# EAGLE design v6845-a (EAGLE 4.13)
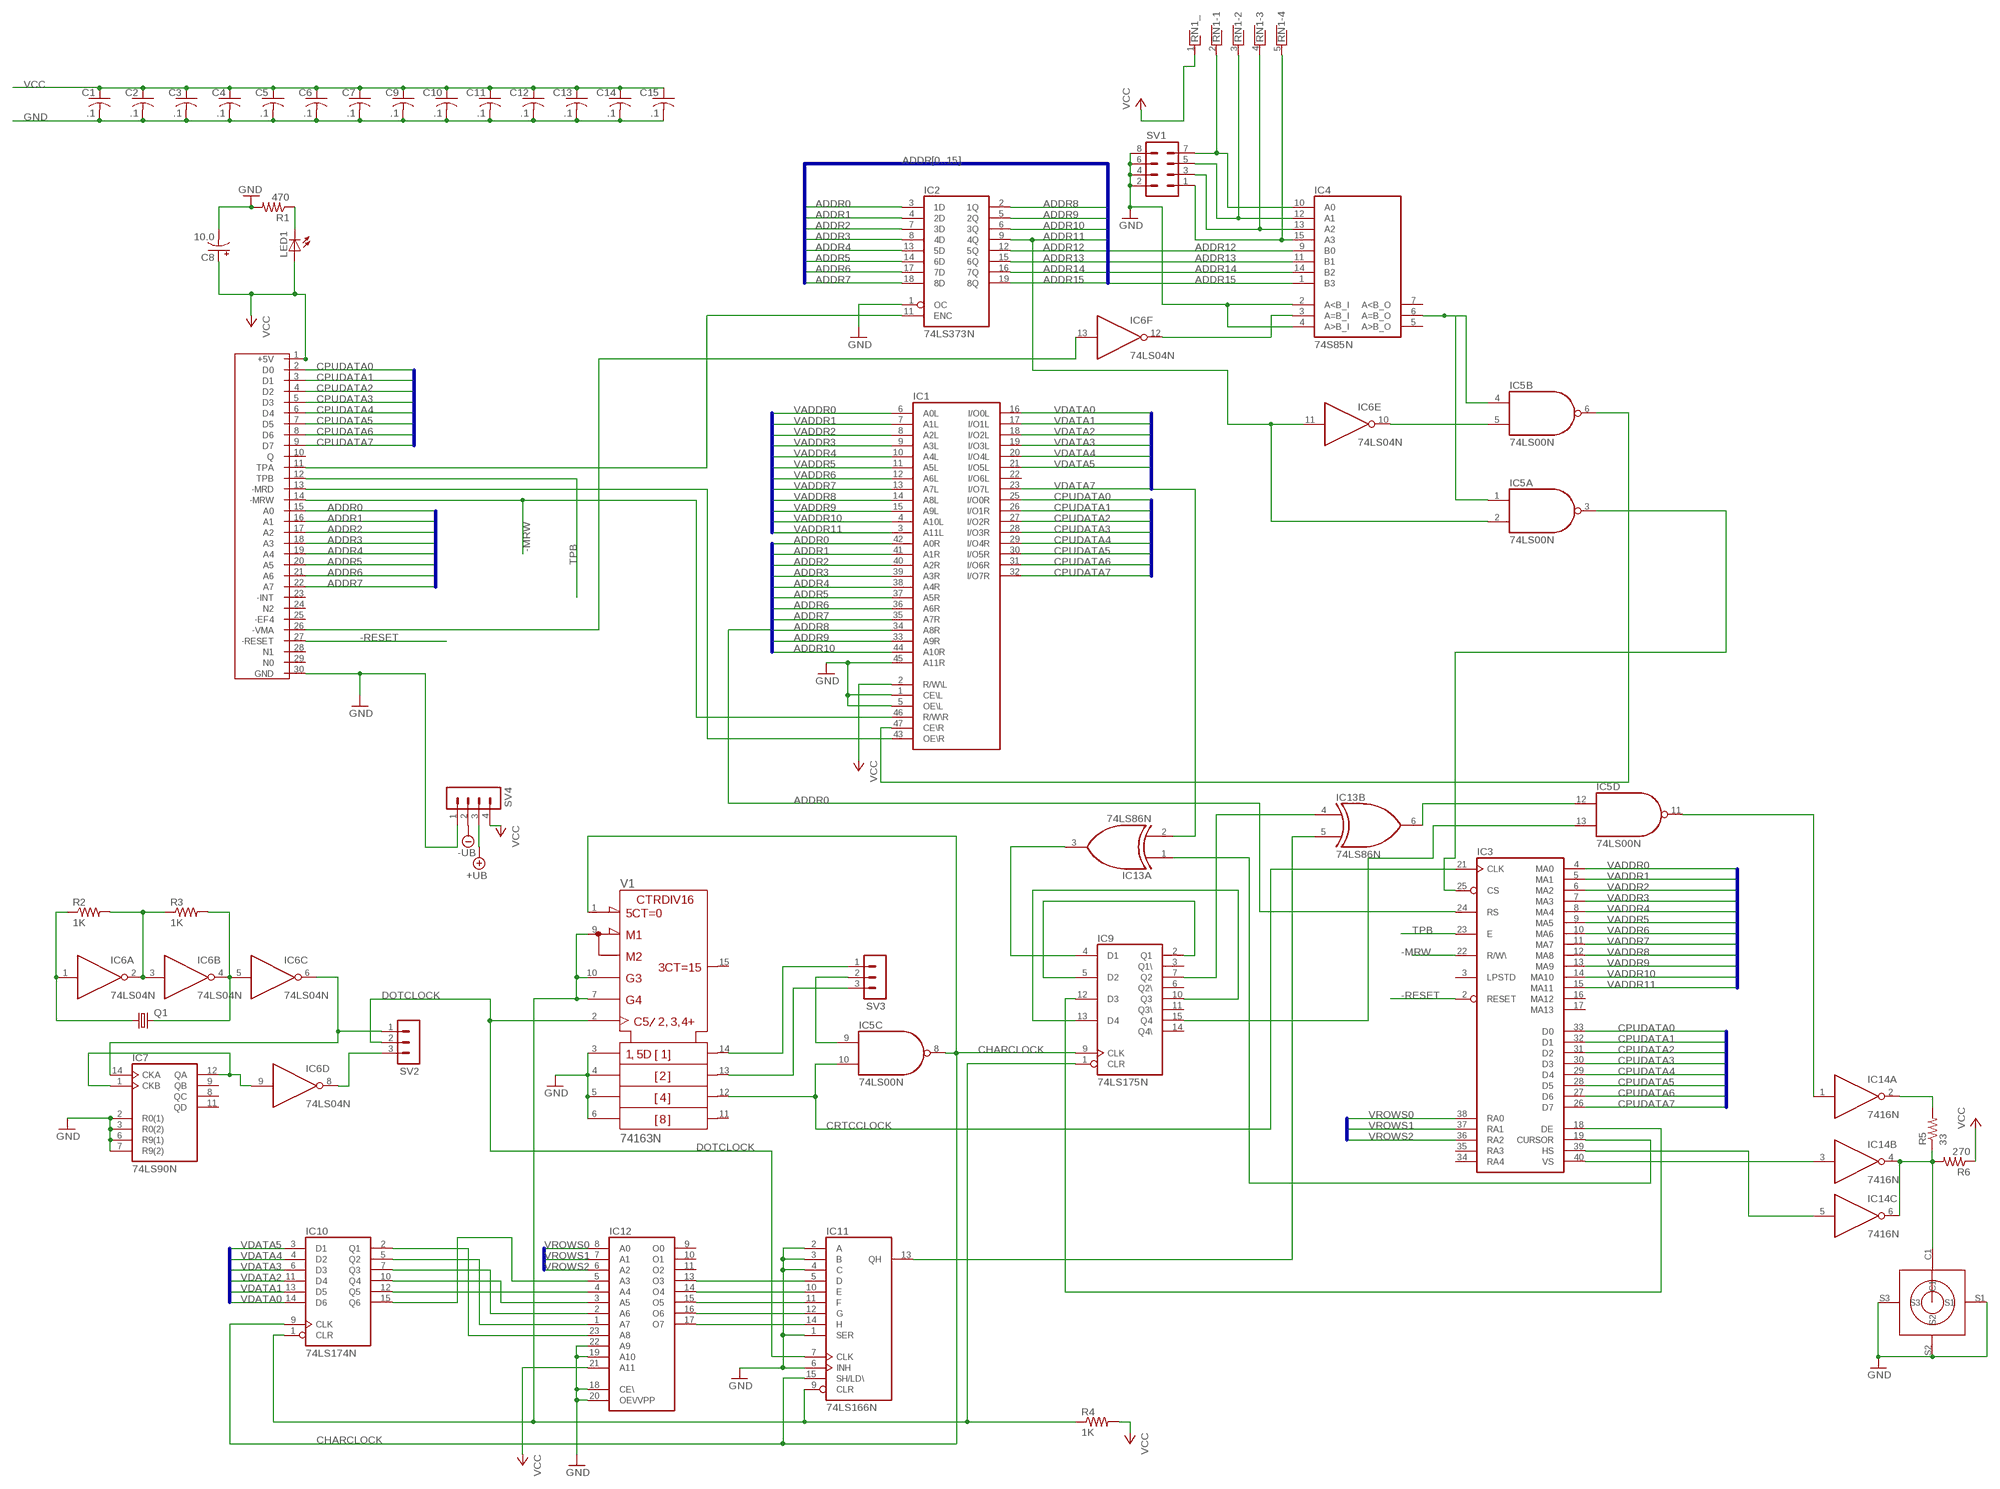
[diagram p0: schematic, sheet 1]

## Parts
C1  .1  C-US025-050X050  [C025-050X050]
C2  .1  C-US025-050X050  [C025-050X050]
C3  .1  C-US025-050X050  [C025-050X050]
C4  .1  C-US025-050X050  [C025-050X050]
C5  .1  C-US025-050X050  [C025-050X050]
C6  .1  C-US025-050X050  [C025-050X050]
C7  .1  C-US025-050X050  [C025-050X050]
C8  10.0  CPOL-USE2.5-7  [E2,5-7]
C9  .1  C-US025-050X050  [C025-050X050]
C10  .1  C-US025-050X050  [C025-050X050]
C11  .1  C-US025-050X050  [C025-050X050]
C12  .1  C-US025-050X050  [C025-050X050]
C13  .1  C-US025-050X050  [C025-050X050]
C14  .1  C-US025-050X050  [C025-050X050]
C15  .1  C-US025-050X050  [C025-050X050]
IC1  7134P  [DIL48]
IC2  74LS373N  [DIL20]
IC3  6845  [DIL40]
IC4  74S85N  [DIL16]
IC5  74LS00N  [DIL14]
IC6  74LS04N  [DIL14]
IC7  74LS90N  [DIL14]
IC9  74LS175N  [DIL16]
IC10  74LS174N  [DIL16]
IC11  74LS166N  [DIL16]
IC12  2732  [DIL24]
IC13  74LS86N  [DIL14]
IC14  7416N  [DIL14]
LED1  LED5MM  [LED5MM]
Q1  CRYTALHC49U-V  [HC49U-V]
R1  470  R-US_0207/7  [0207/7]
R2  1K  R-US_0207/7  [0207/7]
R3  1K  R-US_0207/7  [0207/7]
R4  1K  R-US_0207/7  [0207/7]
R5  33  R-US_0207/7  [0207/7]
R6  270  R-US_0207/7  [0207/7]
RN1  RNX4  [RN-5]
SV1  MA04-2  [MA04-2]
SV2  MA03-1  [MA03-1]
SV3  MA03-1  [MA03-1]
SV4  MA04-1  [MA04-1]
U$1  C30  [C30]
U$4  RCA  [RCA]
V1  74163N  [DIL16]

## Nets
+UB: SV4.3
-MRW: IC1.46(R/W\R) IC3.22(R/W\) U$1.14(-MRW)
-RESET: IC3.2(RESET) U$1.27(-RESET)
-UB: SV4.2
ADDR0: IC1.42(A0R) IC2.3(1D) IC3.24(RS) U$1.15(A0)
ADDR1: IC1.41(A1R) IC2.4(2D) U$1.16(A1)
ADDR2: IC1.40(A2R) IC2.7(3D) U$1.17(A2)
ADDR3: IC1.39(A3R) IC2.8(4D) U$1.18(A3)
ADDR4: IC1.38(A4R) IC2.13(5D) U$1.19(A4)
ADDR5: IC1.37(A5R) IC2.14(6D) U$1.20(A5)
ADDR6: IC1.36(A6R) IC2.17(7D) U$1.21(A6)
ADDR7: IC1.35(A7R) IC2.18(8D) U$1.22(A7)
ADDR8: IC1.34(A8R) IC2.2(1Q)
ADDR9: IC1.33(A9R) IC2.5(2Q)
ADDR10: IC1.44(A10R) IC2.6(3Q)
ADDR11: IC2.9(4Q) IC5.2(A:I1) IC6.11(E:I)
ADDR12: IC2.12(5Q) IC4.9(B0)
ADDR13: IC2.15(6Q) IC4.11(B1)
ADDR14: IC2.16(7Q) IC4.14(B2)
ADDR15: IC2.19(8Q) IC4.1(B3)
CHARCLOCK: IC5.8(C:O) IC9.9(CLK) IC10.9(CLK) IC11.15(SH/LD\) V1.1(CLR\)
CPUDATA0: IC1.25(I/O0R) IC3.33(D0) U$1.2(D0)
CPUDATA1: IC1.26(I/O1R) IC3.32(D1) U$1.3(D1)
CPUDATA2: IC1.27(I/O2R) IC3.31(D2) U$1.4(D2)
CPUDATA3: IC1.28(I/O3R) IC3.30(D3) U$1.5(D3)
CPUDATA4: IC1.29(I/O4R) IC3.29(D4) U$1.6(D4)
CPUDATA5: IC1.30(I/O5R) IC3.28(D5) U$1.7(D5)
CPUDATA6: IC1.31(I/O6R) IC3.27(D6) U$1.8(D6)
CPUDATA7: IC1.32(I/O7R) IC3.26(D7) U$1.9(D7)
CRTCCLOCK: IC3.21(CLK) IC5.10(C:I1) V1.12(QC)
DOTCLOCK: IC11.7(CLK) SV2.2 V1.2(CLK)
GND: C1.2 C2.2 C3.2 C4.2 C5.2 C6.2 C7.2 C8.- C9.2 C10.2 C11.2 C12.2 C13.2 C14.2 C15.2 IC1.1(CE\L) IC1.5(OE\L) IC1.45(A11R) IC2.1(OC) IC4.2(A<B_I) IC4.4(A>B_I) IC7.2(R0(1)) IC7.3(R0(2)) IC7.6(R9(1)) IC7.7(R9(2)) IC11.1(SER) IC11.2(A) IC11.3(B) IC11.4(C) IC11.6(INH) IC12.18(CE\) IC12.19(A10) IC12.20(OE\/VPP) IC12.22(A9) R1.2 SV1.2 SV1.4 SV1.6 SV1.8 SV4.1 U$1.30(GND) U$4.S1 U$4.S2 U$4.S3 V1.3(A) V1.4(B) V1.5(C) V1.6(D)
N$1: IC1.43(OE\R) U$1.13(-MRD)
N$2: IC5.5(B:I1) IC6.10(E:O)
N$3: IC3.25(CS) IC5.3(A:O)
N$4: IC4.10(A0) RN1.2 SV1.7
N$5: IC4.12(A1) RN1.3 SV1.5
N$6: IC4.13(A2) RN1.4 SV1.3
N$7: IC4.15(A3) RN1.5 SV1.1
N$8: IC4.3(A=B_I) IC6.12(F:O)
N$9: IC1.47(CE\R) IC5.6(B:O)
N$10: IC9.1(CLR) IC10.1(CLR) IC11.9(CLR) R4.1 V1.7(ENP) V1.9(LOAD\) V1.10(ENT)
N$11: IC6.4(B:O) IC6.5(C:I) Q1.2 R3.2
N$12: IC6.1(A:I) Q1.1 R2.1
N$13: IC6.6(C:O) IC7.14(CKA) SV2.1
N$14: IC6.2(A:O) IC6.3(B:I) R2.2 R3.1
N$15: IC6.9(D:I) IC7.1(CKB) IC7.12(QA)
N$16: IC6.8(D:O) SV2.3
N$17: IC3.19(CURSOR) IC13.1(A:I0)
N$18: SV3.1 V1.14(QA)
N$19: SV3.3 V1.13(QB)
N$20: IC5.9(C:I0) SV3.2
N$21: IC9.4(D1) IC13.3(A:O)
N$22: LED1.K(C) R1.1
N$23: IC9.2(Q1) IC9.5(D2)
N$24: IC11.5(D) IC12.13(O3)
N$25: IC11.10(E) IC12.14(O4)
N$26: IC11.11(F) IC12.15(O5)
N$27: IC11.12(G) IC12.16(O6)
N$28: IC11.14(H) IC12.17(O7)
N$29: IC10.2(Q1) IC12.23(A8)
N$30: IC10.5(Q2) IC12.1(A7)
N$31: IC10.7(Q3) IC12.2(A6)
N$32: IC10.10(Q4) IC12.3(A5)
N$33: IC10.12(Q5) IC12.4(A4)
N$34: IC10.15(Q6) IC12.5(A3)
N$35: IC9.7(Q2) IC13.4(B:I0)
N$36: IC11.13(QH) IC13.5(B:I1)
N$37: IC9.10(Q3) IC9.13(D4)
N$38: IC3.18(DE) IC9.12(D3)
N$39: IC5.12(D:I0) IC13.6(B:O)
N$40: IC5.13(D:I1) IC9.15(Q4)
N$41: IC3.40(VS) IC14.3(B:I)
N$42: IC3.39(HS) IC14.5(C:I)
N$43: IC5.11(D:O) IC14.1(A:I)
N$44: IC14.4(B:O) IC14.6(C:O) R5.1 R6.2 U$4.C1
N$45: IC14.2(A:O) R5.2
N$46: IC4.6(A=B_O) IC5.1(A:I0) IC5.4(B:I0)
N$47: IC6.13(F:I) U$1.26(-VMA)
TPA: IC2.11(ENC) U$1.11(TPA)
TPB: IC3.23(E) U$1.12(TPB)
VADDR0: IC1.6(A0L) IC3.4(MA0)
VADDR1: IC1.7(A1L) IC3.5(MA1)
VADDR2: IC1.8(A2L) IC3.6(MA2)
VADDR3: IC1.9(A3L) IC3.7(MA3)
VADDR4: IC1.10(A4L) IC3.8(MA4)
VADDR5: IC1.11(A5L) IC3.9(MA5)
VADDR6: IC1.12(A6L) IC3.10(MA6)
VADDR7: IC1.13(A7L) IC3.11(MA7)
VADDR8: IC1.14(A8L) IC3.12(MA8)
VADDR9: IC1.15(A9L) IC3.13(MA9)
VADDR10: IC1.4(A10L) IC3.14(MA10)
VADDR11: IC1.3(A11L) IC3.15(MA11)
VCC: C1.1 C2.1 C3.1 C4.1 C5.1 C6.1 C7.1 C8.+ C9.1 C10.1 C11.1 C12.1 C13.1 C14.1 C15.1 IC1.2(R/W\L) IC12.21(A11) LED1.A R4.2 R6.1 RN1.1 SV4.4 U$1.1(+5V)
VDATA0: IC1.16(I/O0L) IC10.14(D6)
VDATA1: IC1.17(I/O1L) IC10.13(D5)
VDATA2: IC1.18(I/O2L) IC10.11(D4)
VDATA3: IC1.19(I/O3L) IC10.6(D3)
VDATA4: IC1.20(I/O4L) IC10.4(D2)
VDATA5: IC1.21(I/O5L) IC10.3(D1)
VDATA7: IC1.23(I/O7L) IC13.2(A:I1)
VROWS0: IC3.38(RA0) IC12.8(A0)
VROWS1: IC3.37(RA1) IC12.7(A1)
VROWS2: IC3.36(RA2) IC12.6(A2)
Unconnected: IC1.22(I/O6L) IC3.3(LPSTD) IC3.16(MA12) IC3.17(MA13) IC3.34(RA4) IC3.35(RA3) IC4.5(A>B_O) IC4.7(A<B_O) IC7.8(QC) IC7.9(QB) IC7.11(QD) IC9.3(Q1\) IC9.6(Q2\) IC9.11(Q3\) IC9.14(Q4\) IC12.9(O0) IC12.10(O1) IC12.11(O2) IC13.8(C:O) IC13.9(C:I0) IC13.10(C:I1) IC13.11(D:O) IC13.12(D:I0) IC13.13(D:I1) IC14.8(D:O) IC14.9(D:I) IC14.10(E:O) IC14.11(E:I) IC14.12(F:O) IC14.13(F:I) U$1.10(Q) U$1.23(-INT) U$1.24(N2) U$1.25(-EF4) U$1.28(N1) U$1.29(N0) V1.11(QD) V1.15(RCO)

## Buses
VADDR[0..11]
VDATA[0..7]
CPUDATA[0..7]
ADDR[0..15]
VROWS[0..4]

## Power pins joined to a net without a drawn wire
+UB: V1.16(+UB)
-UB: V1.8(-UB)
GND: IC1.24(GND) IC2.10(GND) IC3.1(GND) IC4.8(GND) IC5.7(P:GND) IC6.7(P:GND) IC7.10(GND) IC9.8(GND) IC10.8(GND) IC11.8(GND) IC12.12(GND) IC13.7(P:GND) IC14.7(P:GND)
VCC: IC1.48(VCC) IC2.20(VCC) IC3.20(VCC) IC4.16(VCC) IC5.14(P:VCC) IC6.14(P:VCC) IC7.5(VCC) IC9.16(VCC) IC10.16(VCC) IC11.16(VCC) IC12.24(VCC) IC13.14(P:VCC) IC14.14(P:VCC)

## Library data of the parts
C1-C7 C9-C15 = rcl:C-US: CAPACITOR, American symbol
C8 = rcl:CPOL-US: POLARIZED CAPACITOR, American symbol
IC1 = memory-idt:7134P: MEMORY
IC2 = 74xx-us:74*373: Octal D type transparent LATCH, edge triggered
IC3 = micro-motorola:6845: MICROCONTROLLER/MEMORY DEVICE
IC4 = 74xx-us:74*85: 4-bit magnitude COMPARATOR
IC5 = 74xx-us:74*00: Quad 2-input NAND gate
IC6 = 74xx-us:74*04: Hex INVERTER
IC7 = 74xx-us:74*90: Decade, divide by twelve and binary COUNTER
IC9 = 74xx-us:74*175: Qadruple D type FLIP FLOP, clear
IC10 = 74xx-us:74*174: Hex D type FLIP FLOP, clear
IC11 = 74xx-us:74*166: 8-bit parallel load SHIFT REGISTER
IC12 = memory:2732: MEMORY
IC13 = 74xx-us:74*86: Quad 2-input EXCLUSIV-OR (XOR) gate
IC14 = 74xx-us:74*16: Hex INVERTER, open collector, high-voltage
LED1 = led:LED: LED OSRAM: - CHIPLED LG R971, LG N971, LY N971, LG Q971, LY Q971, LO R971, LY R971 LH N974, LH R974 LS Q976, LO Q976, LY Q976 LO Q996 - Hyper CHIPLED LW Q18S LB Q993, LB Q99A, LB R99A - SideLED LS A670, LO A670, LY A670, LG A670, LP A670 LB A673, LV A673, LT A673, LW A673 LH A674 LY A675 LS A676, LA A676, LO A676, LY A676, LW A676 LS A679, LY A679, LG A679 - Hyper Micro SIDELED® LS Y876, LA Y876, LO Y876, LY Y876 LT Y87S - SmartLED LW L88C, LW L88S LB L89C, LB L89S, LG L890 LS L89K, LO L89K, LY L89K LS L896, LA L896, LO L896, LY L896 - TOPLED LS T670, LO T670, LY T670, LG T670, LP T670 LSG T670, LSP T670, LSY T670, LOP T670, LYG T670 LG T671, LOG T671, LSG T671 LB T673, LV T673, LT T673, LW T673 LH T674 LS T676, LA T676, LO T676, LY T676, LB T676, LH T676, LSB T676, LW T676 LB T67C, LV T67C, LT T67C, LS T67K, LO T67K, LY T67K, LW E67C LS E67B, LA E67B, LO E67B, LY E67B, LB E67C, LV E67C, LT E67C LW T67C LS T679, LY T679, LG T679 LS T770, LO T770, LY T770, LG T770, LP T770 LB T773, LV T773, LT T773, LW T773 LH T774 LS E675, LA E675, LY E675, LS T675 LS T776, LA T776, LO T776, LY T776, LB T776 LHGB T686 LT T68C, LB T68C - Hyper Mini TOPLED® LB M676 - Mini TOPLED Santana® LG M470 LS M47K, LO M47K, LY M47K Source: http://www.osram.convergy.de/
Q1 = crystal:CRYTAL: CRYSTAL
R1-R6 = rcl:R-US_: RESISTOR, American symbol
RN1 = resistor-net:RNX4: RESISTOR NETWORK
SV1 = con-lstb:MA04-2: PIN HEADER
SV2 SV3 = con-lstb:MA03-1: PIN HEADER
SV4 = con-lstb:MA04-1: PIN HEADER
U$1 = k1:C30
U$4 = cdp:RCA
V1 = 74ttl-din:74*163: Synchrounus 4-bit COUNTER

## Board
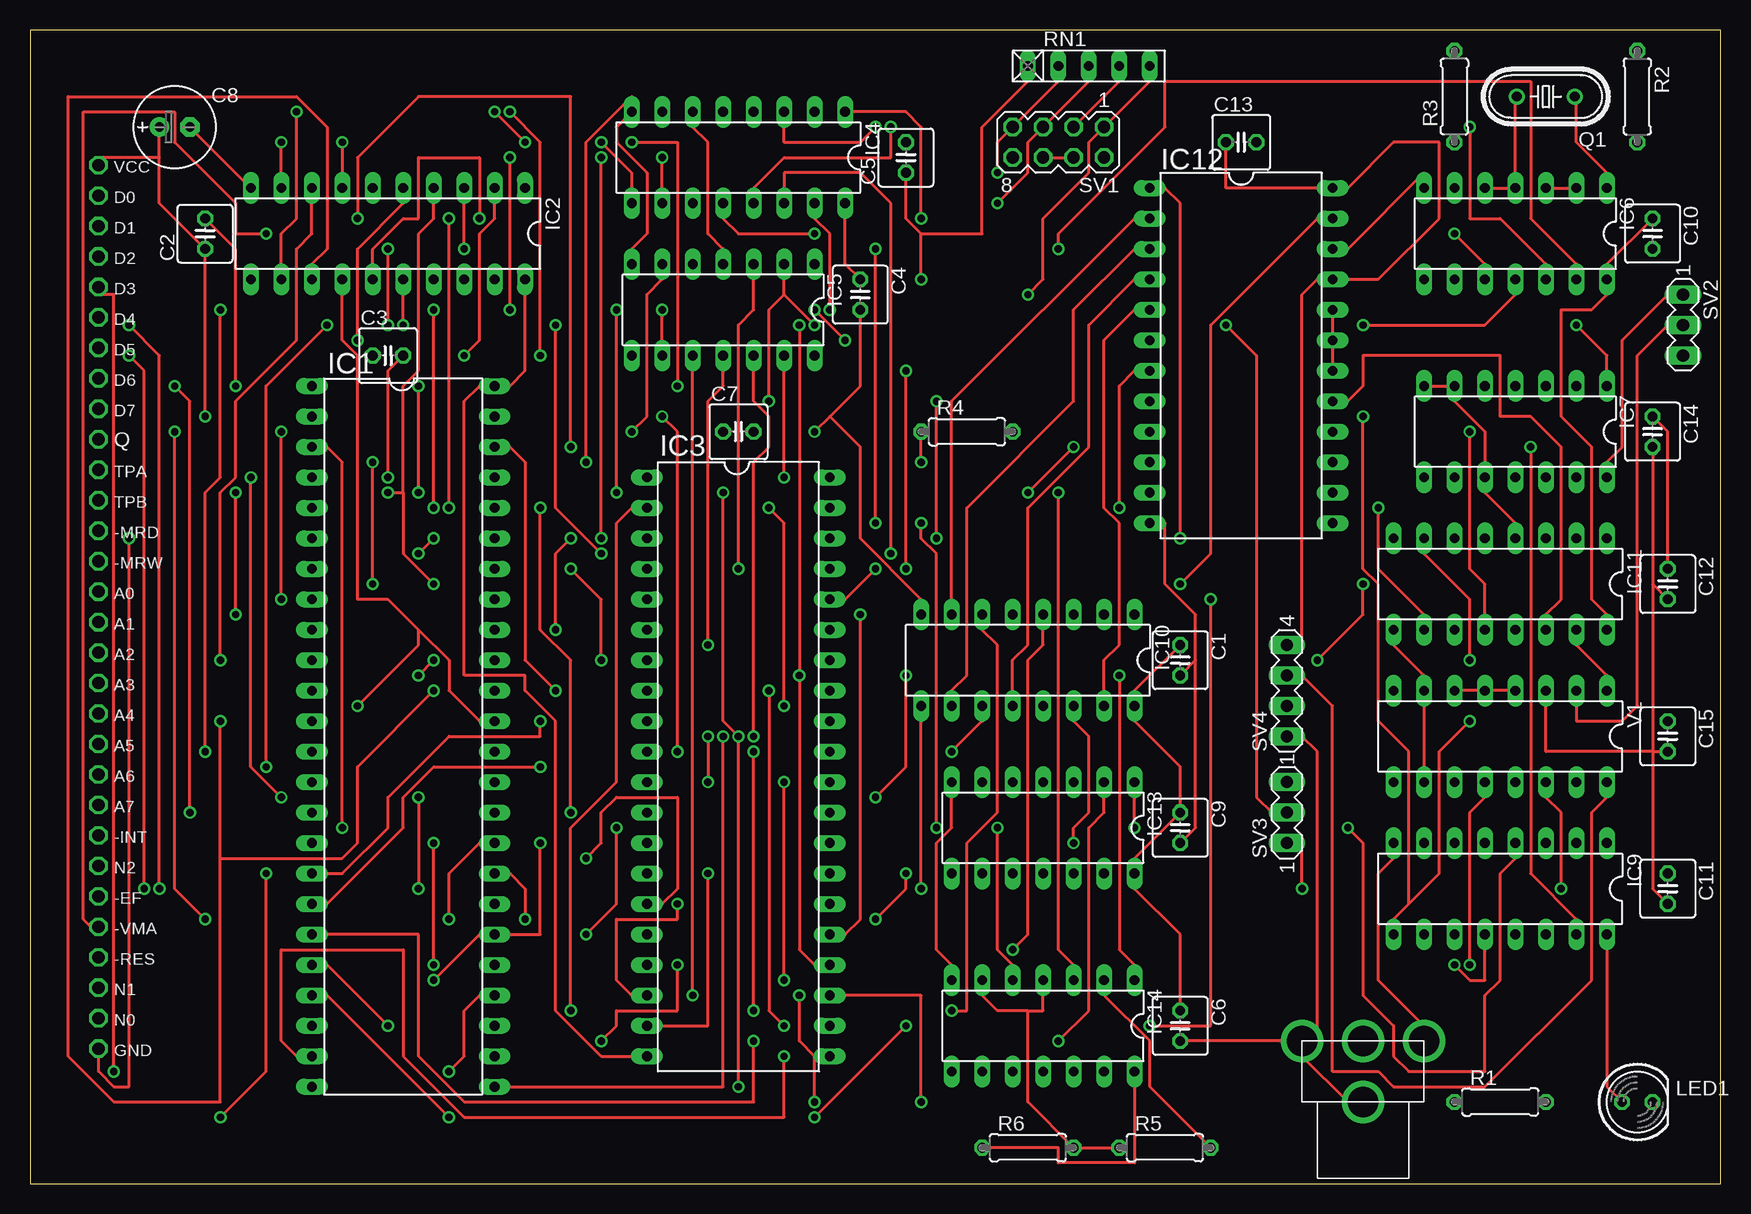
[diagram p1: board, top side]
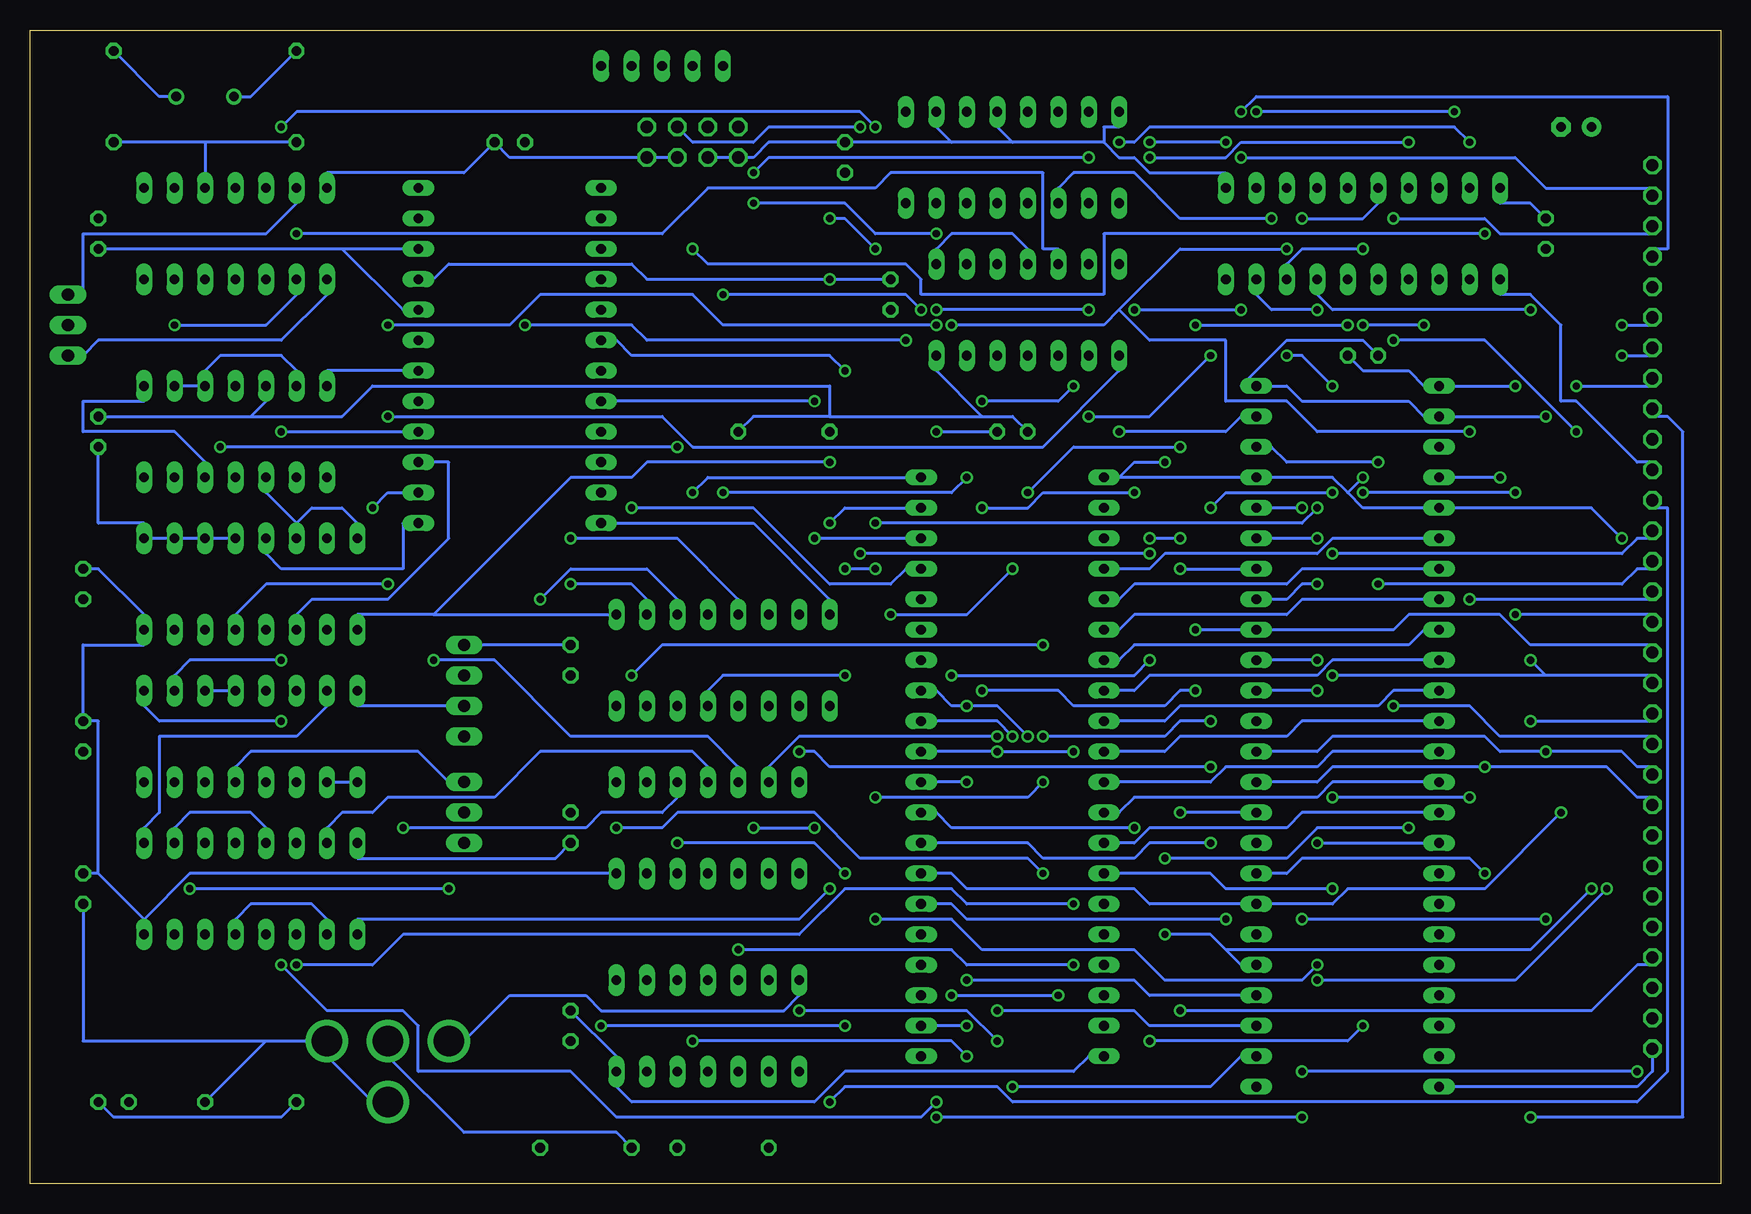
[diagram p2: board, bottom side, seen from below]

Size 140.95 x 96.19 mm. Coordinates in mm from the lower left corner, seen from the top.
Outline: 0,0 140.95,0 140.95,96.19 0,96.19 0,0
Copper layers (1*16): Top 0.035mm / dielectric 1.5mm / Bottom 0.035mm
Design rules "default": minimum track width 10mil, minimum drill 24mil, track to track 8mil, track to pad 8mil, pad to pad 8mil, via to via 8mil, smd to smd 8mil, copper to edge 40mil, drill to drill 8mil, minimum pad ring 10mil, minimum via ring 8mil, stop-mask expansion 4mil, vias tented up to drill 0mil, thermal gap 10mil
tRestrict: area 0.6,91.9 to 76.8,95.7; area 0.6,0.5 to 76.8,4.3
bRestrict: area 0.6,91.9 to 76.8,95.7; area 0.6,0.5 to 76.8,4.3

### Footprints (pad centres in the part's own frame; a part is rotated, then mirrored left to right if it is on the bottom)
C025-050X050 = drill 0.813 octagon: 1 -1.27,0; 2 1.27,0
E2,5-7 = drill 0.813 pad 1.6 round: + -1.27,0 | drill 0.813 pad 1.6 octagon: - 1.27,0
DIL48 = drill 0.813 long: 1 -29.21,-7.62; 2 -26.67,-7.62; 3 -24.13,-7.62; 4 -21.59,-7.62; 5 -19.05,-7.62; 6 -16.51,-7.62; 7 -13.97,-7.62; 8 -11.43,-7.62; 9 -8.89,-7.62; 10 -6.35,-7.62; 11 -3.81,-7.62; 12 -1.27,-7.62; 13 1.27,-7.62; 14 3.81,-7.62; 15 6.35,-7.62; 16 8.89,-7.62; 17 11.43,-7.62; 18 13.97,-7.62; 19 16.51,-7.62; 20 19.05,-7.62; 21 21.59,-7.62; 22 24.13,-7.62; 23 26.67,-7.62; 24 29.21,-7.62; 25 29.21,7.62; 26 26.67,7.62; 27 24.13,7.62; 28 21.59,7.62; 29 19.05,7.62; 30 16.51,7.62; 31 13.97,7.62; 32 11.43,7.62; 33 8.89,7.62; 34 6.35,7.62; 35 3.81,7.62; 36 1.27,7.62; 37 -1.27,7.62; 38 -3.81,7.62; 39 -6.35,7.62; 40 -8.89,7.62; 41 -11.43,7.62; 42 -13.97,7.62; 43 -16.51,7.62; 44 -19.05,7.62; 45 -21.59,7.62; 46 -24.13,7.62; 47 -26.67,7.62; 48 -29.21,7.62
DIL20 = drill 0.813 long: 1 -11.43,-3.81; 2 -8.89,-3.81; 3 -6.35,-3.81; 4 -3.81,-3.81; 5 -1.27,-3.81; 6 1.27,-3.81; 7 3.81,-3.81; 8 6.35,-3.81; 9 8.89,-3.81; 10 11.43,-3.81; 11 11.43,3.81; 12 8.89,3.81; 13 6.35,3.81; 14 3.81,3.81; 15 1.27,3.81; 16 -1.27,3.81; 17 -3.81,3.81; 18 -6.35,3.81; 19 -8.89,3.81; 20 -11.43,3.81
DIL40 = drill 0.813 long: 1 -24.13,-7.62; 2 -21.59,-7.62; 3 -19.05,-7.62; 4 -16.51,-7.62; 5 -13.97,-7.62; 6 -11.43,-7.62; 7 -8.89,-7.62; 8 -6.35,-7.62; 9 -3.81,-7.62; 10 -1.27,-7.62; 11 1.27,-7.62; 12 3.81,-7.62; 13 6.35,-7.62; 14 8.89,-7.62; 15 11.43,-7.62; 16 13.97,-7.62; 17 16.51,-7.62; 18 19.05,-7.62; 19 21.59,-7.62; 20 24.13,-7.62; 21 24.13,7.62; 22 21.59,7.62; 23 19.05,7.62; 24 16.51,7.62; 25 13.97,7.62; 26 11.43,7.62; 27 8.89,7.62; 28 6.35,7.62; 29 3.81,7.62; 30 1.27,7.62; 31 -1.27,7.62; 32 -3.81,7.62; 33 -6.35,7.62; 34 -8.89,7.62; 35 -11.43,7.62; 36 -13.97,7.62; 37 -16.51,7.62; 38 -19.05,7.62; 39 -21.59,7.62; 40 -24.13,7.62
DIL16 = drill 0.813 long: 1 -8.89,-3.81; 2 -6.35,-3.81; 3 -3.81,-3.81; 4 -1.27,-3.81; 5 1.27,-3.81; 6 3.81,-3.81; 7 6.35,-3.81; 8 8.89,-3.81; 9 8.89,3.81; 10 6.35,3.81; 11 3.81,3.81; 12 1.27,3.81; 13 -1.27,3.81; 14 -3.81,3.81; 15 -6.35,3.81; 16 -8.89,3.81
DIL14 = drill 0.813 long: 1 -7.62,-3.81; 2 -5.08,-3.81; 3 -2.54,-3.81; 4 0,-3.81; 5 2.54,-3.81; 6 5.08,-3.81; 7 7.62,-3.81; 8 7.62,3.81; 9 5.08,3.81; 10 2.54,3.81; 11 0,3.81; 12 -2.54,3.81; 13 -5.08,3.81; 14 -7.62,3.81
DIL24 = drill 0.813 long: 1 -13.97,-7.62; 2 -11.43,-7.62; 3 -8.89,-7.62; 4 -6.35,-7.62; 5 -3.81,-7.62; 6 -1.27,-7.62; 7 1.27,-7.62; 8 3.81,-7.62; 9 6.35,-7.62; 10 8.89,-7.62; 11 11.43,-7.62; 12 13.97,-7.62; 13 13.97,7.62; 14 11.43,7.62; 15 8.89,7.62; 16 6.35,7.62; 17 3.81,7.62; 18 1.27,7.62; 19 -1.27,7.62; 20 -3.81,7.62; 21 -6.35,7.62; 22 -8.89,7.62; 23 -11.43,7.62; 24 -13.97,7.62
LED5MM = drill 0.813 octagon: A -1.27,0; K 1.27,0
HC49U-V = drill 0.813 round: 1 -2.413,0; 2 2.413,0
0207/7 = drill 0.813 octagon: 1 -3.81,0; 2 3.81,0
RN-5 = drill 0.813 long: 1 -5.08,0; 2 -2.54,0; 3 0,0; 4 2.54,0; 5 5.08,0
MA04-2 = drill 1.016 octagon: 1 -3.81,-1.27; 2 -3.81,1.27; 3 -1.27,-1.27; 4 -1.27,1.27; 5 1.27,-1.27; 6 1.27,1.27; 7 3.81,-1.27; 8 3.81,1.27
MA03-1 = drill 1.016 long: 1 -2.54,0; 2 0,0; 3 2.54,0
MA04-1 = drill 1.016 long: 1 -3.81,0; 2 -1.27,0; 3 1.27,0; 4 3.81,0
C30 = drill 1.016 octagon: 1 -36.83,0; 2 -34.29,0; 3 -31.75,0; 4 -29.21,0; 5 -26.67,0; 6 -24.13,0; 7 -21.59,0; 8 -19.05,0; 9 -16.51,0; 10 -13.97,0; 11 -11.43,0; 12 -8.89,0; 13 -6.35,0; 14 -3.81,0; 15 -1.27,0; 16 1.27,0; 17 3.81,0; 18 6.35,0; 19 8.89,0; 20 11.43,0; 21 13.97,0; 22 16.51,0; 23 19.05,0; 24 21.59,0; 25 24.13,0; 26 26.67,0; 27 29.21,0; 28 31.75,0; 29 34.29,0; 30 36.83,0
RCA = drill 2.54 round: C1 5.08,0; S1 0,0; S2 5.08,5.08; S3 10.16,0

### Placement (x,y rotation side)
C1  95.88,43.65 270 top
C2  14.6,79.21 90 top
C3  29.84,69.05 0 top
C4  69.21,74.13 270 top
C5  73.02,85.56 90 top
C6  95.88,13.17 270 top
C7  59.05,62.7 0 top
C8  12.06,88.1 0 top
C9  95.88,29.68 270 top
C10  135.25,79.21 270 top
C11  136.52,24.6 270 top
C12  136.52,50 270 top
C13  100.96,86.83 0 top
C14  135.25,62.7 270 top
C15  136.52,37.3 270 top
IC1  31.11,37.3 270 top
IC2  29.84,79.21 180 top
IC3  59.05,34.76 270 top
IC4  59.05,85.56 180 top
IC5  57.78,72.86 180 top
IC6  123.82,79.21 180 top
IC7  123.82,62.7 180 top
IC9  122.55,24.6 180 top
IC10  83.18,43.65 180 top
IC11  122.55,50 180 top
IC12  100.96,69.05 270 top
IC13  84.45,29.68 180 top
IC14  84.45,13.17 180 top
LED1  133.98,6.82 0 top
Q1  126.36,90.64 180 top
R1  122.55,6.82 0 top
R2  133.98,90.64 270 top
R3  118.74,90.64 90 top
R4  78.1,62.7 0 top
R5  94.61,3.01 0 top
R6  83.18,3.01 0 top
RN1  88.26,93.18 0 top
SV1  85.72,86.83 180 top
SV2  137.79,71.59 270 top
SV3  104.77,30.95 90 top
SV4  104.77,41.11 90 top
U$1  5.71,48.09 270 top
U$4  116.2,11.9 180 top
V1  122.55,37.3 180 top

### Tracks (layer width: path | path; a pad name or v marks a point on that pad's centre or on a via)
+UB
  Top 0.254: V1.16 131.44,32.22 130.17,30.95 130.17,16.98 121.28,8.09 113.66,8.09 112.39,9.36 108.58,9.36 108.58,39.84 106.04,42.38 SV4.3
-MRW  (via drill 0.61)
  Top 0.254: v28.57,50 v28.57,60.16 | v62.86,13.17 61.59,14.44 v61.59,41.11 | v43.81,41.11 41.27,43.65 41.27,60.16 40,61.43 IC1.46
  Bottom 0.254: v28.57,60.16 36.19,60.16 37.46,61.43 IC1.46 | v28.57,50 8.25,50 6.98,51.27 5.71,51.27 U$1.14 | v61.59,41.11 55.24,41.11 53.97,39.84 46.35,39.84 45.08,41.11 v43.81,41.11 | v62.86,13.17 IC3.22
-RESET  (via drill 0.61)
  Top 0.254: v45.08,14.44 45.08,29.68 48.89,33.49 48.89,55.08 50.16,56.35 IC3.2
  Bottom 0.254: v45.08,14.44 10.79,14.44 6.98,18.25 5.71,18.25 U$1.27
-UB
  Bottom 0.254: V1.8 113.66,39.84 SV4.2
ADDR0  (via drill 0.61)
  Top 0.254: v64.13,71.59 v64.13,42.38 64.13,19.52 65.4,18.25 IC3.24 | v36.19,77.94 IC2.3 | v45.08,51.27 47.62,48.73 v47.62,43.65 | v20.95,48.73 v20.95,62.7
  Bottom 0.254: v36.19,77.94 45.08,77.94 50.16,72.86 | 50.16,72.86 51.43,71.59 v64.13,71.59 | v47.62,43.65 48.89,42.38 v64.13,42.38 | v45.08,51.27 IC1.42 | v20.95,48.73 5.71,48.73 U$1.15 | v20.95,62.7 33.65,62.7 36.19,65.24 41.27,65.24 41.27,70.32 47.62,70.32 50.16,72.86
ADDR1  (via drill 0.61)
  Top 0.254: v33.65,50 31.11,52.54 31.11,57.62 | 31.11,57.62 31.11,66.51 32.38,67.78 32.38,79.21 33.65,80.48 IC2.4 | v17.14,47.46 v17.14,57.62 | v29.84,57.62 31.11,57.62
  Bottom 0.254: v33.65,50 34.92,50 36.19,48.73 IC1.41 | v17.14,47.46 5.71,47.46 U$1.16 | v17.14,57.62 v29.84,57.62
ADDR2  (via drill 0.61)
  Top 0.254: v47.62,53.81 v47.62,85.56 | v45.08,53.81 43.81,52.54 v43.81,46.19 | v26.03,86.83 IC2.7
  Bottom 0.254: U$1.17 5.71,44.92 15.87,44.92 18.41,47.46 26.03,47.46 27.3,46.19 IC1.40 v43.81,46.19 | v26.03,86.83 40,86.83 41.27,85.56 v47.62,85.56 | v45.08,53.81 v47.62,53.81
ADDR3  (via drill 0.61)
  Top 0.254: v15.87,43.65 15.87,57.62 17.14,58.89 17.14,65.24 22.22,70.32 22.22,77.94 23.49,79.21 IC2.8 | v32.38,42.38 v33.65,43.65
  Bottom 0.254: 14.6,42.38 v15.87,43.65 | 14.6,42.38 5.71,42.38 U$1.18 | 14.6,42.38 v32.38,42.38 | v33.65,43.65 IC1.39
ADDR4  (via drill 0.61)
  Top 0.254: v33.65,41.11 27.3,34.76 27.3,28.41 26.03,27.14 15.87,27.14 | 15.87,27.14 v15.87,38.57 | 15.87,27.14 15.87,6.82 6.98,6.82 3.17,10.63 3.17,90.64 22.22,90.64 24.76,88.1 24.76,77.94 23.49,76.67 IC2.13
  Bottom 0.254: v15.87,38.57 5.71,38.57 U$1.19 | v33.65,41.11 IC1.38
ADDR5  (via drill 0.61)
  Top 0.254: 32.38,46.19 29.84,48.73 27.3,48.73 27.3,69.05 26.03,70.32 IC2.14 | 32.38,46.19 34.92,43.65 34.92,41.11 37.46,38.57 IC1.37 | v27.3,39.84 32.38,44.92 32.38,46.19
  Bottom 0.254: v27.3,39.84 20.95,39.84 18.41,37.3 5.71,37.3 U$1.20
ADDR6  (via drill 0.61)
  Top 0.254: v15.87,72.86 15.87,58.89 14.6,57.62 v14.6,36.03
  Bottom 0.254: v15.87,72.86 32.38,72.86 33.65,74.13 IC2.17 | U$1.21 5.71,34.76 6.98,34.76 8.25,36.03 v14.6,36.03 18.41,36.03 19.68,37.3 32.38,37.3 33.65,36.03 IC1.36
ADDR7  (via drill 0.61)
  Top 0.254: v29.84,71.59 v29.84,77.94 | v24.76,71.59 19.68,66.51 v19.68,34.76
  Bottom 0.254: IC1.35 33.65,33.49 32.38,34.76 v19.68,34.76 9.52,34.76 6.98,32.22 5.71,32.22 U$1.22 | v29.84,77.94 34.92,77.94 36.19,76.67 IC2.18 | v24.76,71.59 v29.84,71.59
ADDR8  (via drill 0.61)
  Top 0.254: v45.08,30.95 45.08,43.65 42.54,46.19 v42.54,56.35 | v32.38,57.62 v32.38,66.51 | v36.19,69.05 37.46,70.32 37.46,79.21 38.73,80.48 IC2.2
  Bottom 0.254: v42.54,56.35 41.27,57.62 v32.38,57.62 | v32.38,66.51 34.92,69.05 v36.19,69.05 | IC1.34 v45.08,30.95
ADDR9  (via drill 0.61)
  Top 0.254: v34.92,22.06 34.92,25.87 37.46,28.41 IC1.33 | v14.6,22.06 12.06,24.6 v12.06,62.7 | v27.3,70.32 27.3,77.94 31.11,81.75 IC2.5
  Bottom 0.254: v14.6,22.06 v34.92,22.06 | v12.06,62.7 19.68,70.32 v27.3,70.32
ADDR10  (via drill 0.61)
  Top 0.254: v34.92,56.35 v34.92,80.48
  Bottom 0.254: v34.92,80.48 29.84,80.48 28.57,81.75 IC2.6 | v34.92,56.35 IC1.44
ADDR11  (via drill 0.61)
  Top 0.254: v111.12,71.59 121.28,71.59 123.82,74.13 IC6.11 | 62.86,74.13 v65.4,71.59 | 62.86,74.13 IC5.2 | v50.16,86.83 53.97,86.83 v53.97,66.51 | v61.59,65.24 61.59,72.86 62.86,74.13 | IC2.9 v20.95,86.83
  Bottom 0.254: v111.12,71.59 100.96,71.59 98.42,74.13 85.72,74.13 83.18,71.59 v65.4,71.59 | v20.95,86.83 22.22,88.1 47.62,88.1 48.89,86.83 v50.16,86.83 | v53.97,66.51 55.24,65.24 v61.59,65.24
ADDR12  (via drill 0.61)
  Top 0.254: v22.22,89.37 22.22,80.48 20.95,79.21 IC2.12 | v38.73,89.37 v41.27,86.83 | v47.62,86.83 50.16,84.29 IC4.9
  Bottom 0.254: v22.22,89.37 v38.73,89.37 | v41.27,86.83 v47.62,86.83
ADDR13  (via drill 0.61)
  Top 0.254: v37.46,80.48 37.46,85.56 32.38,85.56 32.38,80.48 31.11,80.48 28.57,77.94 IC2.15
  Bottom 0.254: v37.46,80.48 45.08,80.48 48.89,84.29 53.97,84.29 55.24,83.02 IC4.11
ADDR14  (via drill 0.61)
  Top 0.254: v43.81,71.59 43.81,56.35 v47.62,52.54 | v71.75,52.54 71.75,81.75 69.21,84.29 62.86,84.29 IC4.14 | v31.11,71.59 IC2.16
  Bottom 0.254: v43.81,71.59 v31.11,71.59 | v47.62,52.54 v71.75,52.54
ADDR15  (via drill 0.61)
  Top 0.254: v33.65,56.35 v33.65,72.86 | v70.48,55.08 v70.48,77.94 | v74.29,80.48 74.29,88.1 73.02,89.37 IC4.1
  Bottom 0.254: v33.65,72.86 37.46,72.86 38.73,74.13 IC2.19 | v33.65,56.35 34.92,55.08 v70.48,55.08 | v70.48,77.94 73.02,80.48 v74.29,80.48
CHARCLOCK  (via drill 0.61)
  Top 0.254: V1.1 131.44,42.38 128.9,44.92 IC11.15 | v111.12,63.97 111.12,51.27 112.39,50 112.39,38.57 114.93,36.03 114.93,23.33 | 114.93,23.33 113.66,22.06 IC9.9 | v74.29,24.6 IC10.9 | v120.01,38.57 117.47,36.03 117.47,25.87 114.93,23.33
  Bottom 0.254: v111.12,63.97 88.26,63.97 85.72,61.43 56.51,61.43 50.16,67.78 IC5.8 | v74.29,24.6 76.83,22.06 113.66,22.06 IC9.9 | v120.01,38.57 130.17,38.57 131.44,39.84 V1.1
CPUDATA0  (via drill 0.61)
  Top 0.254: v57.78,37.3 57.78,8.09 IC1.25 | v40,72.86 v40,85.56 | v48.89,57.62 v48.89,72.86 | v61.59,56.35 62.86,55.08 v62.86,39.84
  Bottom 0.254: v57.78,37.3 60.32,39.84 v62.86,39.84 64.13,39.84 65.4,41.11 IC3.33 | v40,85.56 17.14,85.56 14.6,83.02 5.71,83.02 U$1.2 | v48.89,72.86 v40,72.86 | v48.89,57.62 56.51,57.62 57.78,56.35 v61.59,56.35
CPUDATA1  (via drill 0.61)
  Top 0.254: v59.05,8.09 v59.05,37.3 57.78,38.57 v57.78,57.62 | v27.3,80.48 27.3,85.56 32.38,90.64 45.08,90.64 v45.08,61.43
  Bottom 0.254: v59.05,8.09 42.54,8.09 40,10.63 IC1.26 | v59.05,37.3 60.32,38.57 IC3.32 | v27.3,80.48 19.68,80.48 18.41,79.21 5.71,79.21 U$1.3 | v45.08,61.43 53.97,61.43 v57.78,57.62
CPUDATA2  (via drill 0.61)
  Top 0.254: v60.32,14.44 v60.32,36.03 | v40,89.37 42.54,86.83 v42.54,69.05 | v52.7,63.97 53.97,62.7 v53.97,36.03
  Bottom 0.254: v60.32,14.44 48.89,14.44 47.62,13.17 IC1.27 | IC3.31 v60.32,36.03 v53.97,36.03 | v40,89.37 38.73,90.64 4.44,90.64 4.44,77.94 5.71,77.94 U$1.4 | v42.54,69.05 47.62,63.97 v52.7,63.97
CPUDATA3  (via drill 0.61)
  Top 0.254: v62.86,16.98 v62.86,33.49 | v6.98,9.36 6.98,74.13 5.71,74.13 U$1.5 | v34.92,9.36 36.19,10.63 36.19,14.44 37.46,15.71 IC1.28
  Bottom 0.254: v62.86,16.98 48.89,16.98 47.62,15.71 IC1.28 | v62.86,33.49 IC3.30 | v6.98,9.36 v34.92,9.36
CPUDATA4  (via drill 0.61)
  Top 0.254: v46.35,20.79 48.89,23.33 v48.89,29.68 | v8.25,71.59 10.79,69.05 v10.79,24.6
  Bottom 0.254: 41.27,19.52 42.54,20.79 v46.35,20.79 | 41.27,19.52 40,18.25 IC1.29 | v48.89,29.68 64.13,29.68 65.4,30.95 IC3.29 | v8.25,71.59 5.71,71.59 U$1.6 | v10.79,24.6 15.87,19.52 41.27,19.52
CPUDATA5  (via drill 0.61)
  Top 0.254: v42.54,28.41 42.54,20.79 IC1.30 37.46,20.79 v33.65,16.98 | v8.25,69.05 9.52,67.78 v9.52,24.6
  Bottom 0.254: v42.54,28.41 47.62,28.41 48.89,27.14 56.51,27.14 57.78,28.41 IC3.28 | v8.25,69.05 5.71,69.05 U$1.7 | v9.52,24.6 17.14,16.98 v33.65,16.98
CPUDATA6  (via drill 0.61)
  Top 0.254: v12.06,66.51 13.33,65.24 v13.33,30.95
  Bottom 0.254: IC3.27 64.13,25.87 62.86,24.6 48.89,24.6 47.62,23.33 IC1.31 32.38,23.33 31.11,24.6 19.68,24.6 v13.33,30.95 | v12.06,66.51 5.71,66.51 U$1.8
CPUDATA7  (via drill 0.61)
  Top 0.254: v41.27,22.06 41.27,24.6 40,25.87 IC1.32 | v15.87,5.55 19.68,9.36 v19.68,25.87
  Bottom 0.254: v41.27,22.06 62.86,22.06 64.13,23.33 IC3.26 | v15.87,5.55 3.17,5.55 3.17,62.7 4.44,63.97 5.71,63.97 U$1.9 | v19.68,25.87 20.95,27.14 34.92,27.14 36.19,25.87 IC1.32
CRTCCLOCK  (via drill 0.61)
  Top 0.254: 65.4,10.63 64.13,11.9 v64.13,15.71 | v55.24,15.71 IC5.10 | v120.01,18.25 120.01,30.95 121.28,32.22 V1.12 | v65.4,6.82 65.4,10.63 | 65.4,10.63 IC3.21
  Bottom 0.254: v64.13,15.71 v55.24,15.71 | v120.01,18.25 116.2,14.44 109.85,14.44 108.58,13.17 108.58,9.36 95.88,9.36 92.07,5.55 66.67,5.55 v65.4,6.82
DOTCLOCK  (via drill 0.61)
  Top 0.254: v120.01,43.65 120.01,48.73 116.2,52.54 IC11.7 | SV2.2 136.52,71.59 133.98,69.05 133.98,39.84 132.71,38.57 128.9,38.57 V1.2
  Bottom 0.254: v120.01,43.65 127.63,43.65 128.9,42.38 V1.2
GND  (via drill 0.61)
  Top 0.254: IC2.10 C8.- | C3.2 29.84,67.78 v29.84,58.89 | C2.2 17.14,77.94 v17.14,66.51 | v8.25,53.81 8.25,8.09 6.98,8.09 5.71,9.36 U$1.30 | 66.67,63.97 69.21,66.51 C4.2 | 66.67,63.97 v65.4,62.7 | 97.15,43.65 C1.2 | 97.15,43.65 97.15,47.46 94.61,50 94.61,55.08 IC12.12 | C9.2 97.15,29.68 97.15,43.65 | 66.67,63.97 69.21,61.43 69.21,53.81 74.29,48.73 IC10.8 | IC14.7 76.83,18.25 75.56,19.52 75.56,28.41 76.83,29.68 IC13.7 | U$4.S3 C6.2 | SV4.1 106.04,37.3 107.31,36.03 107.31,11.9 U$4.S3 | U$4.S2 109.85,6.82 106.04,10.63 U$4.S3 | V1.6 V1.5 V1.4 | 135.25,36.03 126.36,36.03 V1.3 | 135.25,36.03 C15.2 | 135.25,50 C12.2 | C14.2 135.25,50 | IC12.18 IC12.19 IC12.20 | IC7.7 IC7.6 118.74,65.24 121.28,62.7 IC7.10 121.28,57.62 123.82,55.08 IC11.4 | 135.25,50 135.25,36.03 | IC5.7 50.16,77.94 51.43,79.21 51.43,84.29 48.89,86.83 48.89,88.1 IC4.8 50.16,90.64 46.35,86.83 v46.35,60.16 | SV1.6 SV1.4 | IC12.22 109.85,77.94 116.2,84.29 IC6.7 | C11.2 135.25,24.6 135.25,36.03 | IC9.8 113.66,27.14 112.39,25.87 112.39,16.98 116.2,13.17 U$4.S1
  Bottom 0.254: IC1.24 6.98,8.09 5.71,9.36 U$1.30 | C2.2 15.87,81.75 18.41,81.75 IC2.10 | C3.2 29.84,67.78 26.03,67.78 24.76,66.51 IC1.1 v17.14,66.51 | 31.11,57.62 32.38,58.89 IC1.45 50.16,58.89 | 31.11,57.62 29.84,56.35 IC1.5 10.79,56.35 v8.25,53.81 | 31.11,57.62 v29.84,58.89 | v65.4,62.7 C7.2 | C9.2 97.15,27.14 113.66,27.14 IC9.8 | IC10.8 74.29,48.73 80.64,55.08 IC12.12 | 121.28,11.9 R1.2 | 121.28,11.9 U$4.S1 116.2,10.63 112.39,6.82 U$4.S2 | C11.2 136.52,11.9 121.28,11.9 | IC14.7 76.83,15.71 78.1,14.44 93.34,14.44 94.61,15.71 100.96,15.71 104.77,11.9 U$4.S3 | V1.3 V1.4 | 118.74,55.08 117.47,56.35 114.93,56.35 113.66,55.08 IC11.8 | IC7.2 IC7.3 126.36,67.78 125.09,69.05 120.01,69.05 118.74,67.78 IC7.6 | IC11.4 IC11.3 IC11.2 IC11.1 131.44,55.08 135.25,55.08 C14.2 | IC12.18 116.2,67.78 IC7.7 | 118.74,55.08 121.28,57.62 IC7.10 | 118.74,55.08 IC11.6 | 51.43,86.83 50.16,85.56 48.89,85.56 47.62,84.29 41.27,84.29 IC2.1 | 51.43,86.83 51.43,88.1 50.16,88.1 IC4.8 | 59.05,86.83 60.32,88.1 IC4.4 | 51.43,86.83 59.05,86.83 | 64.13,86.83 65.4,88.1 IC4.2 | 59.05,86.83 64.13,86.83 | 64.13,86.83 C5.2 79.37,86.83 80.64,85.56 SV1.8 SV1.6 | SV1.4 SV1.2 100.96,85.56 C13.2 104.77,84.29 116.2,84.29 IC6.7 | 114.93,77.94 C10.2 | IC12.22 114.93,77.94 | 114.93,77.94 109.85,72.86 IC12.20 | 50.16,58.89 48.89,60.16 v46.35,60.16 | 50.16,58.89 IC3.1
N$1  (via drill 0.61)
  Top 0.254: v32.38,52.54 v33.65,53.81
  Bottom 0.254: v32.38,52.54 8.25,52.54 6.98,53.81 5.71,53.81 U$1.13 | v33.65,53.81 IC1.43
N$2  (via drill 0.61)
  Top 0.254: v118.74,79.21 121.28,76.67 IC6.10
  Bottom 0.254: v118.74,79.21 88.26,79.21 84.45,83.02 70.48,83.02 69.21,84.29 56.51,84.29 56.51,77.94 55.24,77.94 IC5.5
N$3  (via drill 0.61)
  Top 0.254: v59.05,51.27 59.05,71.59 60.32,72.86 IC5.3 | v69.21,47.46 69.21,22.06 67.94,20.79 IC3.25
  Bottom 0.254: v59.05,51.27 62.86,47.46 v69.21,47.46
N$4  (via drill 0.61)
  Top 0.254: v80.64,84.29 80.64,86.83 SV1.7 85.72,91.91 RN1.2 | IC4.10 v52.7,85.56
  Bottom 0.254: v52.7,85.56 79.37,85.56 v80.64,84.29
N$5  (via drill 0.61)
  Top 0.254: v65.4,79.21 59.05,79.21 57.78,80.48 IC4.12 | v80.64,81.75 83.18,84.29 83.18,86.83 SV1.5 88.26,91.91 RN1.3
  Bottom 0.254: v65.4,79.21 70.48,79.21 73.02,81.75 v80.64,81.75
N$6  (via drill 0.61)
  Top 0.254: v71.75,88.1 71.75,85.56 62.86,85.56 60.32,83.02 IC4.13 | SV1.3 90.8,91.91 RN1.4
  Bottom 0.254: v71.75,88.1 79.37,88.1 80.64,86.83 85.72,86.83 SV1.3
N$7  (via drill 0.61)
  Top 0.254: v66.67,72.86 66.67,79.21 65.4,80.48 IC4.15 | v83.18,74.13 84.45,75.4 84.45,80.48 88.26,84.29 88.26,86.83 SV1.1 93.34,91.91 RN1.5
  Bottom 0.254: v66.67,72.86 67.94,74.13 v83.18,74.13
N$8  (via drill 0.61)
  Top 0.254: v120.01,88.1 120.01,80.48 122.55,80.48 126.36,76.67 IC6.12 | v70.48,88.1 69.21,86.83 62.86,86.83 IC4.3
  Bottom 0.254: v120.01,88.1 118.74,89.37 71.75,89.37 v70.48,88.1
N$9  (via drill 0.61)
  Top 0.254: v50.16,62.7 51.43,63.97 51.43,74.13 52.7,75.4 IC5.6
  Bottom 0.254: v50.16,62.7 41.27,62.7 40,63.97 IC1.47
N$10  (via drill 0.61)
  Top 0.254: IC11.9 113.66,44.92 116.2,42.38 V1.7 V1.10 | v74.29,60.16 R4.1
  Bottom 0.254: V1.10 V1.9 | IC9.1 131.44,29.68 130.17,30.95 130.17,37.3 118.74,37.3 116.2,39.84 V1.7 | 107.31,47.46 113.66,47.46 IC11.9 | 107.31,47.46 IC10.1 | v74.29,60.16 89.53,60.16 90.8,58.89 95.88,58.89 107.31,47.46
N$11
  Top 0.254: IC6.5 IC6.4 123.82,90.64 Q1.2
  Bottom 0.254: R3.2 122.55,90.64 Q1.2
N$12
  Top 0.254: IC6.1 131.44,84.29 128.9,86.83 128.9,90.64 Q1.1
  Bottom 0.254: R2.1 130.17,90.64 Q1.1
N$13
  Top 0.254: IC7.14 131.44,60.16 132.71,61.43 132.71,70.32 136.52,74.13 SV2.1
  Bottom 0.254: IC6.6 118.74,81.75 121.28,79.21 136.52,79.21 136.52,74.13 SV2.1
N$14
  Top 0.254: IC6.3 IC6.2
  Bottom 0.254: 126.36,86.83 R2.2 | R3.1 126.36,86.83 | 126.36,86.83 IC6.3
N$15  (via drill 0.61)
  Top 0.254: v128.9,71.59 131.44,69.05 IC7.1
  Bottom 0.254: IC7.12 126.36,60.16 128.9,62.7 136.52,62.7 136.52,65.24 131.44,65.24 IC7.1 | v128.9,71.59 121.28,71.59 118.74,74.13 IC6.9
N$16
  Bottom 0.254: IC6.8 116.2,74.13 120.01,70.32 135.25,70.32 136.52,69.05 SV2.3
N$17  (via drill 0.61)
  Top 0.254: v56.51,25.87 56.51,13.17 IC3.19 | v92.07,29.68 IC13.1
  Bottom 0.254: v56.51,25.87 57.78,27.14 71.75,27.14 75.56,30.95 86.99,30.95 88.26,29.68 v92.07,29.68
N$18  (via drill 0.61)
  Top 0.254: v127.63,24.6 127.63,30.95 126.36,32.22 V1.14 | v106.04,24.6 106.04,28.41 SV3.1
  Bottom 0.254: v106.04,24.6 v127.63,24.6
N$19
  Bottom 0.254: V1.13 123.82,34.76 122.55,36.03 108.58,36.03 106.04,33.49 SV3.3
N$20  (via drill 0.61)
  Top 0.254: v65.4,72.86 v67.94,70.32 | v99.69,71.59 102.23,69.05 102.23,32.22 103.5,30.95 SV3.2 | IC5.9 v52.7,72.86
  Bottom 0.254: v52.7,72.86 v65.4,72.86 | v67.94,70.32 89.53,70.32 90.8,71.59 v99.69,71.59
N$21  (via drill 0.61)
  Top 0.254: v109.85,29.68 111.12,28.41 111.12,15.71 113.66,13.17 113.66,10.63 114.93,9.36 121.28,9.36 121.28,15.71 122.55,16.98 122.55,25.87 123.82,27.14 IC9.4
  Bottom 0.254: v109.85,29.68 94.61,29.68 93.34,30.95 88.26,30.95 86.99,32.22 IC13.3
N$22
  Bottom 0.254: R1.1 120.01,5.55 133.98,5.55 LED1.K
N$23
  Bottom 0.254: IC9.5 121.28,29.68 122.55,30.95 127.63,30.95 128.9,29.68 IC9.2
N$24
  Bottom 0.254: IC12.13 109.85,55.08 109.85,51.27 120.01,51.27 121.28,52.54 IC11.5
N$25  (via drill 0.61)
  Top 0.254: v112.39,56.35 112.39,51.27 116.2,47.46 IC11.10
  Bottom 0.254: v112.39,56.35 111.12,57.62 IC12.14
N$26
  Bottom 0.254: IC11.11 118.74,47.46 117.47,48.73 111.12,48.73 106.04,53.81 106.04,60.16 IC12.15
N$27  (via drill 0.61)
  Top 0.254: v120.01,62.7 120.01,51.27 121.28,50 IC11.12
  Bottom 0.254: v120.01,62.7 IC12.16
N$28
  Top 0.254: IC11.14 126.36,47.46 127.63,48.73 127.63,61.43 125.09,63.97 122.55,63.97 122.55,69.05 111.12,69.05 111.12,66.51 109.85,65.24 IC12.17
N$29  (via drill 0.61)
  Top 0.254: v95.88,50 98.42,52.54 98.42,71.59 107.31,80.48 IC12.23
  Bottom 0.254: v95.88,50 90.8,50 89.53,48.73 IC10.2
N$30  (via drill 0.61)
  Top 0.254: v95.88,53.81 95.88,81.75 94.61,83.02 IC12.1
  Bottom 0.254: v95.88,53.81 86.99,53.81 81.91,48.73 IC10.5
N$31
  Top 0.254: IC10.7 76.83,65.24 92.07,80.48 IC12.2
N$32
  Top 0.254: IC10.10 76.83,41.11 78.1,42.38 78.1,56.35 86.99,65.24 86.99,72.86 92.07,77.94 IC12.3
N$33
  Top 0.254: IC10.12 81.91,43.65 83.18,44.92 83.18,56.35 88.26,61.43 88.26,71.59 92.07,75.4 IC12.4
N$34
  Top 0.254: IC10.15 89.53,43.65 90.8,44.92 90.8,55.08 89.53,56.35 89.53,70.32 92.07,72.86 IC12.5
N$35
  Bottom 0.254: IC13.4 84.45,34.76 85.72,36.03 98.42,36.03 102.23,32.22 111.12,32.22 112.39,30.95 114.93,30.95 116.2,29.68 IC9.7
N$36  (via drill 0.61)
  Top 0.254: v107.31,43.65 111.12,47.46 v111.12,50
  Bottom 0.254: v107.31,43.65 102.23,43.65 95.88,37.3 84.45,37.3 81.91,34.76 IC13.5 | v111.12,50 121.28,50 123.82,47.46 IC11.13
N$37
  Bottom 0.254: IC9.10 116.2,22.06 117.47,23.33 122.55,23.33 123.82,22.06 IC9.13
N$38  (via drill 0.61)
  Top 0.254: v53.97,23.33 53.97,22.06 48.89,22.06 48.89,16.98 50.16,15.71 IC3.18 | v118.74,18.25 120.01,16.98 121.28,16.98 IC9.12
  Bottom 0.254: v53.97,23.33 62.86,23.33 64.13,24.6 73.02,24.6 76.83,20.79 109.85,20.79 112.39,18.25 v118.74,18.25
N$39  (via drill 0.61)
  Top 0.254: v60.32,37.3 60.32,60.16 61.59,61.43 61.59,63.97 60.32,65.24 IC5.12
  Bottom 0.254: v60.32,37.3 76.83,37.3 79.37,34.76 IC13.6
N$40  (via drill 0.61)
  Top 0.254: v83.18,57.62 v86.99,61.43 | v125.09,61.43 125.09,25.87 128.9,22.06 IC9.15 | v62.86,58.89 IC5.13
  Bottom 0.254: v62.86,58.89 64.13,57.62 v83.18,57.62 | v86.99,61.43 v125.09,61.43
N$41  (via drill 0.61)
  Top 0.254: v85.72,57.62 85.72,19.52 86.99,18.25 IC14.3
  Bottom 0.254: v85.72,57.62 84.45,58.89 IC3.40
N$42  (via drill 0.61)
  Top 0.254: v80.64,29.68 80.64,19.52 81.91,18.25 IC14.5 | v75.56,29.68 75.56,52.54 74.29,53.81 v74.29,55.08
  Bottom 0.254: v80.64,29.68 v75.56,29.68 | v74.29,55.08 73.02,56.35 IC3.39
N$43  (via drill 0.61)
  Top 0.254: v90.8,42.38 90.8,19.52 92.07,18.25 IC14.1 | v56.51,44.92 56.51,65.24 57.78,66.51 IC5.11
  Bottom 0.254: v90.8,42.38 88.26,44.92 v56.51,44.92
N$44
  Top 0.254: R5.1 R6.2 83.18,6.82 83.18,14.44 | 83.18,14.44 84.45,14.44 IC14.4 | 83.18,14.44 80.64,14.44 79.37,15.71 IC14.6
  Bottom 0.254: R5.1 92.07,4.28 104.77,4.28 111.12,10.63 U$4.C1
N$45
  Top 0.254: R5.2 93.34,8.09 93.34,11.9 89.53,15.71 IC14.2
N$46
  Top 0.254: IC4.6 55.24,88.1 56.51,86.83 56.51,79.21 57.78,77.94 IC5.4
  Bottom 0.254: IC5.4 57.78,77.94 59.05,79.21 64.13,79.21 65.4,77.94 IC5.1
N$47  (via drill 0.61)
  Top 0.254: v85.72,77.94 85.72,79.21 94.61,88.1 94.61,91.91 125.09,91.91 125.09,80.48 128.9,76.67 IC6.13 | v19.68,79.21 17.14,79.21 17.14,81.75 12.06,86.83 12.06,89.37 4.44,89.37 4.44,22.06 5.71,20.79 U$1.26
  Bottom 0.254: v85.72,77.94 84.45,76.67 67.94,76.67 66.67,75.4 66.67,74.13 51.43,74.13 51.43,79.21 v19.68,79.21
TPA
  Bottom 0.254: IC2.11 18.41,74.13 15.87,74.13 13.33,71.59 13.33,65.24 12.06,65.24 6.98,60.16 5.71,60.16 U$1.11
TPB  (via drill 0.61)
  Top 0.254: v74.29,6.82 74.29,15.71 IC3.23
  Bottom 0.254: v74.29,6.82 73.02,8.09 60.32,8.09 59.05,6.82 6.98,6.82 4.44,9.36 4.44,56.35 5.71,56.35 U$1.12
VADDR0
  Bottom 0.254: IC1.6 32.38,53.81 33.65,52.54 46.35,52.54 47.62,51.27 IC3.4
VADDR1
  Bottom 0.254: IC1.7 34.92,51.27 36.19,50 48.89,50 50.16,48.73 IC3.5
VADDR2
  Bottom 0.254: IC1.8 34.92,48.73 36.19,47.46 48.89,47.46 50.16,46.19 IC3.6
VADDR3
  Bottom 0.254: IC1.9 24.76,46.19 26.03,44.92 48.89,44.92 50.16,43.65 IC3.7
VADDR4
  Bottom 0.254: IC1.10 32.38,43.65 33.65,42.38 47.62,42.38 48.89,41.11 IC3.8
VADDR5
  Bottom 0.254: IC3.9 46.35,38.57 45.08,39.84 28.57,39.84 27.3,41.11 IC1.11
VADDR6
  Bottom 0.254: IC1.12 34.92,38.57 36.19,37.3 45.08,37.3 46.35,36.03 IC3.10
VADDR7
  Bottom 0.254: IC3.11 42.54,33.49 41.27,34.76 33.65,34.76 32.38,36.03 IC1.13
VADDR8
  Bottom 0.254: IC1.14 32.38,33.49 33.65,32.22 48.89,32.22 50.16,30.95 IC3.12
VADDR9
  Bottom 0.254: IC1.15 34.92,30.95 36.19,29.68 47.62,29.68 48.89,28.41 IC3.13
VADDR10  (via drill 0.61)
  Top 0.254: v32.38,32.22 v32.38,24.6 | v20.95,32.22 18.41,34.76 v18.41,58.89
  Bottom 0.254: v32.38,24.6 41.27,24.6 42.54,25.87 IC3.14 | v20.95,32.22 v32.38,32.22 | v18.41,58.89 IC1.4
VADDR11  (via drill 0.61)
  Top 0.254: v26.03,29.68 26.03,60.16 24.76,61.43 IC1.3 | v46.35,27.14 47.62,28.41 47.62,30.95 48.89,32.22 53.97,32.22 53.97,24.6 52.7,23.33 IC3.15
  Bottom 0.254: v26.03,29.68 33.65,29.68 36.19,27.14 v46.35,27.14
VCC  (via drill 0.61)
  Top 0.254: LED1.A 131.44,8.09 IC9.16 | C10.1 131.44,76.67 IC6.14 131.44,74.13 130.17,72.86 127.63,72.86 127.63,63.97 130.17,61.43 130.17,48.73 131.44,47.46 IC11.16 | C14.1 136.52,62.7 C12.1 | C5.1 73.02,80.48 74.29,79.21 | 74.29,79.21 79.37,79.21 79.37,88.1 83.18,91.91 RN1.1 | C13.1 99.69,83.02 IC12.24 109.85,83.02 113.66,86.83 117.47,86.83 117.47,80.48 112.39,75.4 IC12.21 107.31,75.4 106.04,74.13 106.04,44.92 SV4.4 | C1.1 92.07,41.11 IC10.16 92.07,38.57 95.88,34.76 C9.1 92.07,27.14 IC13.14 92.07,24.6 95.88,20.79 C6.1 | C4.1 67.94,76.67 IC4.16 | v74.29,75.4 74.29,79.21 | 10.79,85.56 C8.+ | 10.79,85.56 10.79,81.75 C2.1 v14.6,63.97 | 10.79,85.56 5.71,85.56 U$1.1 | IC2.20 41.27,67.78 40,66.51 IC1.48 37.46,66.51 36.19,65.24 36.19,42.38 41.27,42.38 41.27,41.11 43.81,38.57 43.81,14.44 47.62,10.63 IC3.20 | R6.1 85.72,3.01 85.72,1.74 92.07,1.74 IC14.14
  Bottom 0.254: C7.1 59.05,63.97 61.59,63.97 | 61.59,63.97 65.4,67.78 IC5.14 | R4.2 80.64,63.97 74.29,63.97 | 74.29,63.97 61.59,63.97 | 131.44,22.06 135.25,25.87 | 135.25,25.87 C11.1 | C12.1 135.25,51.27 131.44,47.46 IC11.16 131.44,44.92 136.52,44.92 C15.1 135.25,38.57 135.25,25.87 | 122.55,63.97 121.28,65.24 IC7.5 | C14.1 122.55,63.97 | 74.29,63.97 74.29,66.51 112.39,66.51 114.93,63.97 122.55,63.97 | C4.1 v74.29,75.4 89.53,75.4 90.8,76.67 106.04,76.67 107.31,75.4 IC12.21 | C1.1 SV4.4 | C3.1 29.84,70.32 36.19,70.32 40,66.51 IC1.48 36.19,66.51 34.92,65.24 26.03,65.24 24.76,63.97 IC1.2 v14.6,63.97 | IC3.20 52.7,10.63 53.97,9.36 73.02,9.36 75.56,6.82 90.8,6.82 92.07,8.09 IC14.14 92.07,10.63 C6.1 | 131.44,22.06 127.63,25.87 IC13.14 | 131.44,22.06 IC9.16
VDATA0  (via drill 0.61)
  Top 0.254: v33.65,18.25 v33.65,28.41 | v70.48,22.06 73.02,24.6 v73.02,25.87 | v86.99,28.41 86.99,29.68 88.26,30.95 88.26,37.3 86.99,38.57 IC10.14
  Bottom 0.254: v33.65,18.25 34.92,16.98 46.35,16.98 48.89,19.52 61.59,19.52 64.13,22.06 v70.48,22.06 | v73.02,25.87 75.56,28.41 v86.99,28.41 | v33.65,28.41 IC1.16
VDATA1  (via drill 0.61)
  Top 0.254: v42.54,38.57 42.54,37.3 34.92,37.3 29.84,32.22 29.84,29.68 26.03,25.87 IC1.17 | v56.51,37.3 v56.51,33.49 | v70.48,32.22 73.02,34.76 v73.02,42.38
  Bottom 0.254: v42.54,38.57 45.08,38.57 46.35,37.3 v56.51,37.3 | v56.51,33.49 57.78,32.22 v70.48,32.22 | v73.02,42.38 83.18,42.38 84.45,41.11 IC10.13
VDATA2  (via drill 0.61)
  Top 0.254: v42.54,34.76 33.65,34.76 31.11,32.22 31.11,29.68 24.76,23.33 IC1.18 | v76.83,36.03 79.37,38.57 IC10.11
  Bottom 0.254: v42.54,34.76 74.29,34.76 75.56,36.03 v76.83,36.03
VDATA3  (via drill 0.61)
  Top 0.254: v60.32,11.9 60.32,6.82 36.19,6.82 32.38,10.63 32.38,20.79 IC1.19 | v76.83,14.44 78.1,14.44 78.1,28.41 80.64,30.95 80.64,44.92 79.37,46.19 IC10.6
  Bottom 0.254: v60.32,11.9 62.86,14.44 v76.83,14.44
VDATA4  (via drill 0.61)
  Top 0.254: v29.84,13.17 24.76,18.25 IC1.20 | v47.62,11.9 48.89,13.17 48.89,14.44 53.97,14.44 v53.97,18.25 | v81.91,19.52 83.18,20.79 83.18,43.65 84.45,44.92 IC10.4
  Bottom 0.254: v29.84,13.17 31.11,11.9 v47.62,11.9 | v53.97,18.25 62.86,18.25 64.13,19.52 v81.91,19.52
VDATA5  (via drill 0.61)
  Top 0.254: v34.92,5.55 24.76,15.71 IC1.21 | v65.4,5.55 v73.02,13.17 | v93.34,13.17 98.42,13.17 v98.42,48.73
  Bottom 0.254: v34.92,5.55 v65.4,5.55 | v73.02,13.17 v93.34,13.17 | v98.42,48.73 95.88,51.27 89.53,51.27 86.99,48.73 IC10.3
VDATA7  (via drill 0.61)
  Top 0.254: v62.86,10.63 62.86,5.55 36.19,5.55 31.11,10.63 31.11,19.52 20.95,19.52 20.95,11.9 22.22,10.63 IC1.23 | v85.72,11.9 88.26,14.44 88.26,29.68 89.53,30.95 IC13.2
  Bottom 0.254: v62.86,10.63 64.13,11.9 v85.72,11.9
VROWS0  (via drill 0.61)
  Top 0.254: v75.56,53.81 v75.56,65.24
  Bottom 0.254: IC3.38 v75.56,53.81 | v75.56,65.24 IC12.8
VROWS1  (via drill 0.61)
  Top 0.254: v90.8,56.35 90.8,66.51 92.07,67.78 IC12.7
  Bottom 0.254: v90.8,56.35 80.64,56.35 74.29,50 69.21,50 67.94,51.27 IC3.37
VROWS2  (via drill 0.61)
  Top 0.254: v70.48,51.27 67.94,48.73 IC3.36 | v73.02,51.27 v73.02,67.78
  Bottom 0.254: v70.48,51.27 v73.02,51.27 | v73.02,67.78 74.29,69.05 90.8,69.05 92.07,70.32 IC12.6